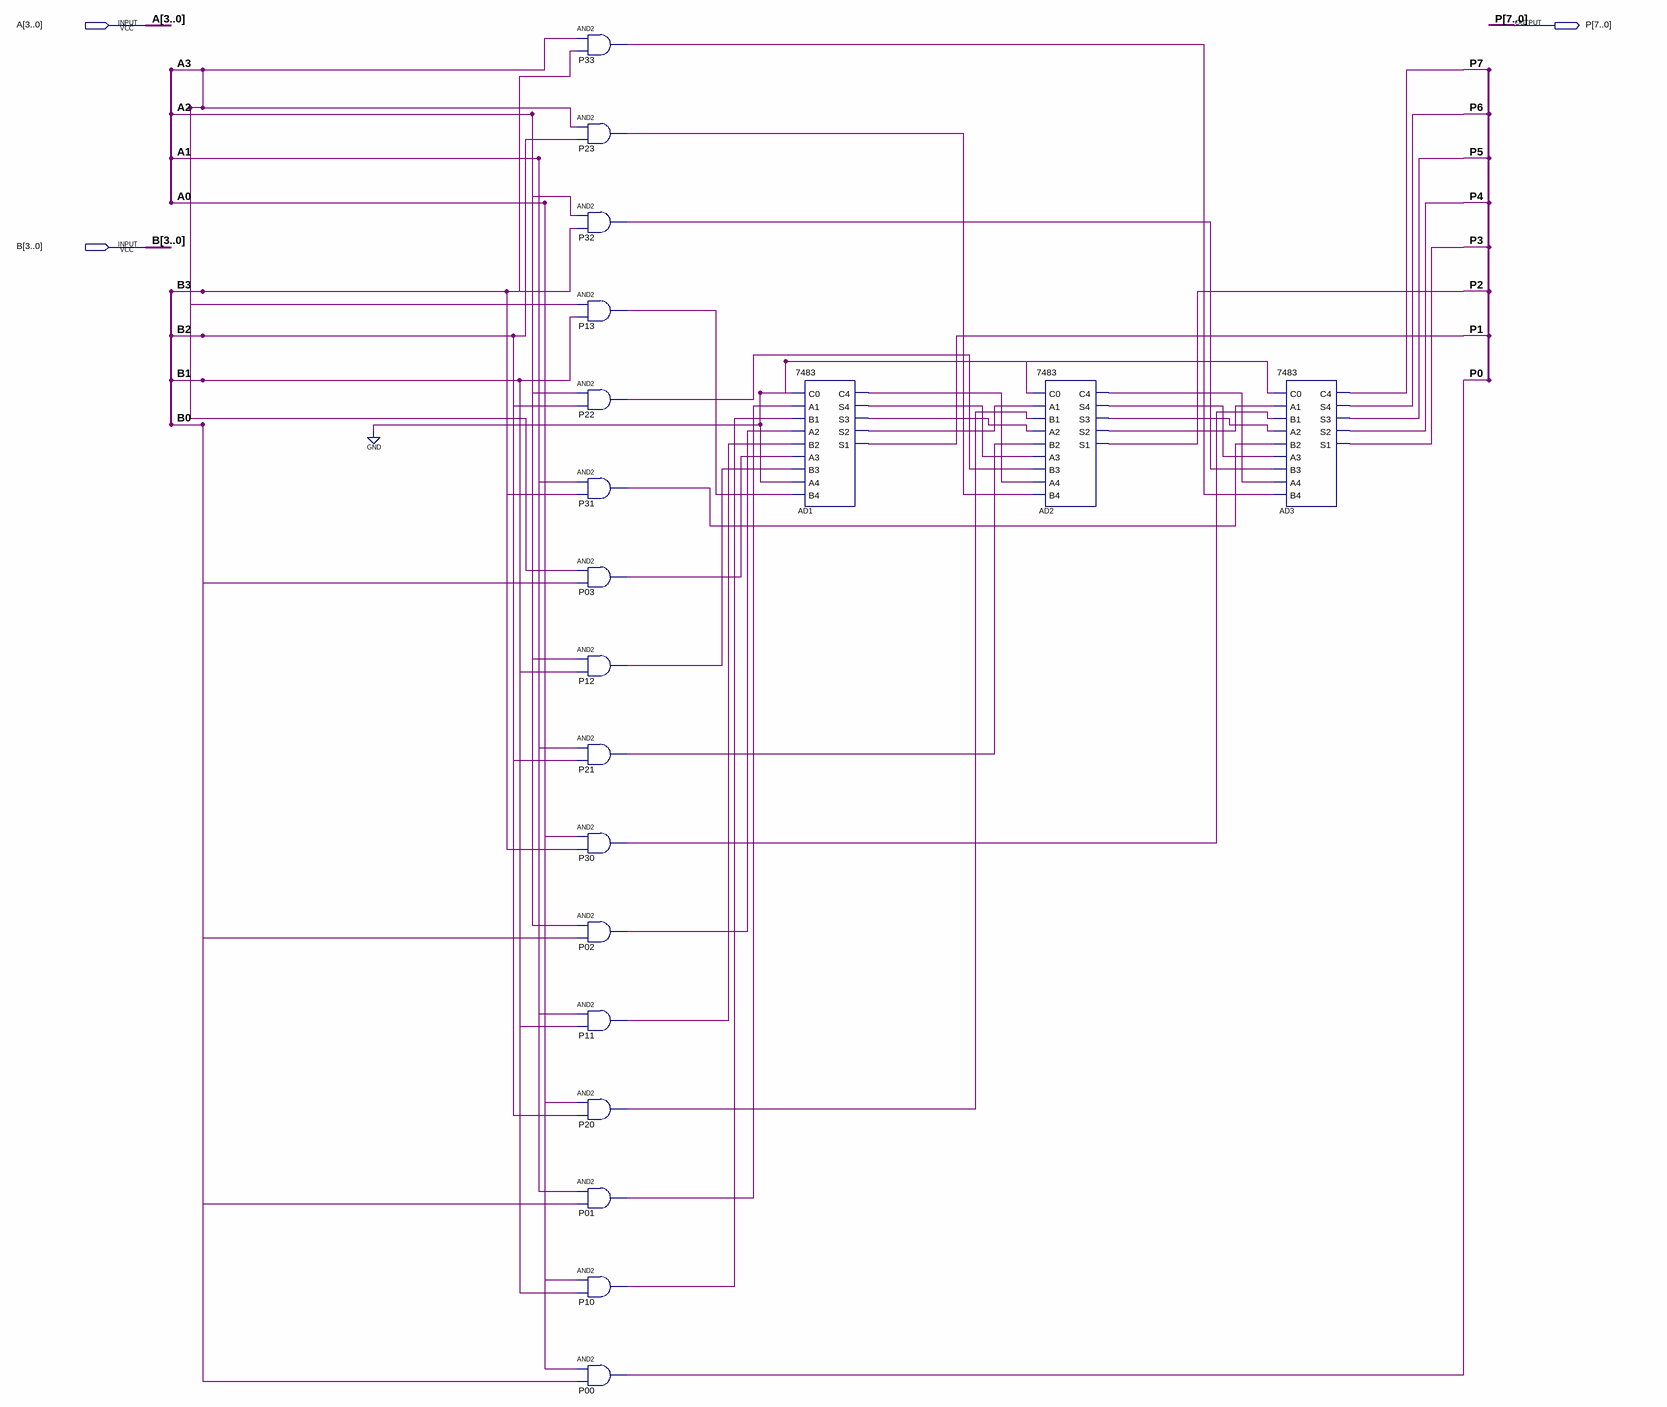
[diagram p0: schematic sheet]
// Quartus schematic mult4.bdf as structural Verilog: 19 symbols, 3 pins
module mult4 (
  input  [3:0] A,
  input  [3:0] B,
  output [7:0] P
);

  wire AD1_c4, AD1_s2, AD1_s3, AD1_s4, AD2_c4, AD2_s2, AD2_s3, AD2_s4, P01_out, P02_out, P03_out, P10_out,
       P11_out, P12_out, P13_out, P20_out, P21_out, P22_out, P23_out, P30_out, P31_out, P32_out, P33_out;

  and P33 (P33_out, A[3], B[3]);
  and P23 (P23_out, A[3], B[2]);
  and P32 (P32_out, A[2], B[3]);
  and P13 (P13_out, A[3], B[1]);
  and P22 (P22_out, A[2], B[2]);
  and P31 (P31_out, A[1], B[3]);
  and P03 (P03_out, A[3], B[0]);
  and P12 (P12_out, A[2], B[1]);
  and P21 (P21_out, A[1], B[2]);
  and P30 (P30_out, A[0], B[3]);
  and P02 (P02_out, A[2], B[0]);
  and P11 (P11_out, A[1], B[1]);
  and P20 (P20_out, A[0], B[2]);
  and P01 (P01_out, A[1], B[0]);
  and P10 (P10_out, A[0], B[1]);
  and P00 (P[0], A[0], B[0]);
  \7483  AD1 (
    .C0(1'b0), .A1(P01_out), .B1(P10_out), .A2(P02_out), .B2(P11_out), .A3(P03_out), .B3(P12_out), .A4(1'b0),
    .B4(P13_out), .C4(AD1_c4), .S4(AD1_s4), .S3(AD1_s3), .S2(AD1_s2), .S1(P[1]));
  \7483  AD2 (
    .C0(1'b0), .A1(AD1_s2), .B1(P20_out), .A2(AD1_s3), .B2(P21_out), .A3(AD1_s4), .B3(P22_out), .A4(AD1_c4),
    .B4(P23_out), .C4(AD2_c4), .S4(AD2_s4), .S3(AD2_s3), .S2(AD2_s2), .S1(P[2]));
  \7483  AD3 (
    .C0(1'b0), .A1(AD2_s2), .B1(P30_out), .A2(AD2_s3), .B2(P31_out), .A3(AD2_s4), .B3(P32_out), .A4(AD2_c4),
    .B4(P33_out), .C4(P[7]), .S4(P[6]), .S3(P[5]), .S2(P[4]), .S1(P[3]));
endmodule
